# Altium schematic sheet Battery_Charging_Section.SchDoc
size A4; DocumentNumber: 3; SheetNumber: 3; SheetTotal: 8
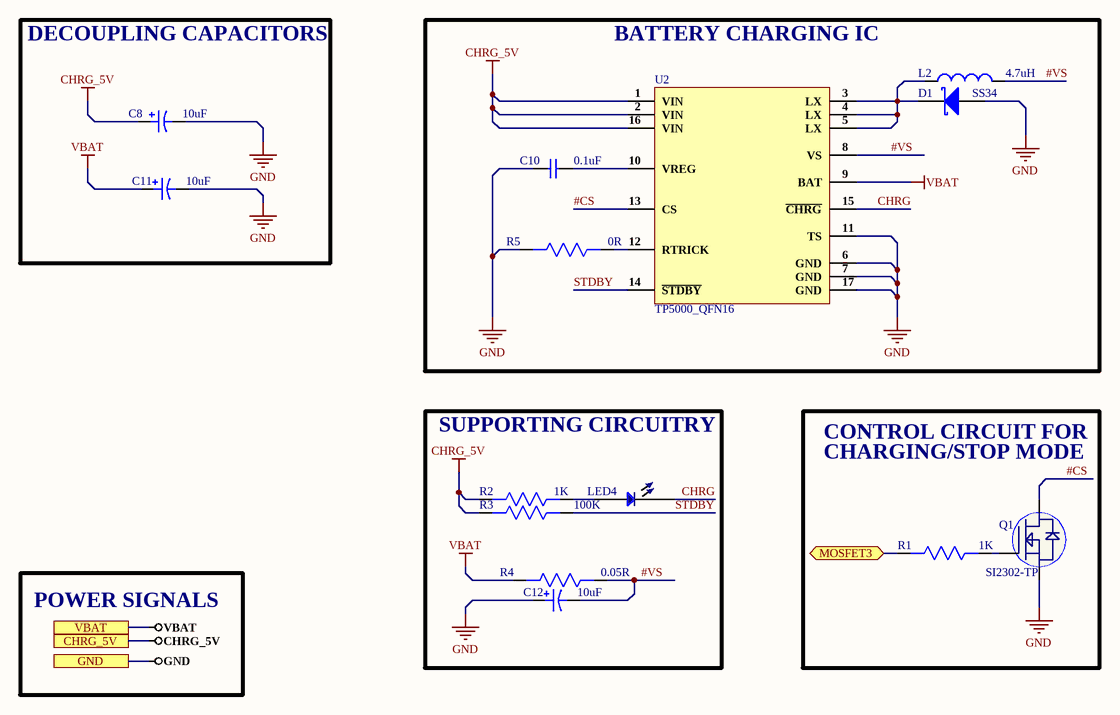
[diagram p0: Battery_Charging_Section.SchDoc]

## Parts
C8  10uF  [UWX1H100MCL1GB]
C10  0.1uF  [Cap0603]
C11  10uF  [UWX1H100MCL1GB]
C12  10uF  [UWX1H100MCL1GB]
D1  SS34  [SMA]
L2  4.7uH  [NR5040T4R7N]
LED4  204-10SURT/S530-A3  [TH-LED]  (value not drawn)
Q1  SI2302-TP  [SI2302-TP]
R1  1K  [Res0603]
R2  1K  [Res0603]
R3  100K  [Res0603]
R4  0.05R  [Res0603]
R5  0R  [Res0603]
U2  TP5000_QFN16  [16-QFN (4x4)]

## Blocks framed on the sheet
DECOUPLING CAPACITORS: C8 C11
BATTERY CHARGING IC: C10 D1 L2 R5 U2
SUPPORTING CIRCUITRY: C12 LED4 R2-R4

## Ports
CHRG_5V, GND, MOSFET3 (bidir), VBAT

## Nets
CHRG_5V: C8.1 R2.2 R3.2 U2.1(VIN) U2.2(VIN) U2.16(VIN) ; port CHRG_5V
GND: C8.2 C10.1 C11.2 C12.1 D1.1(A) Q1.2(S) R5.2 U2.6(GND) U2.7(GND) U2.11(TS) U2.17(GND) ; port GND
VBAT: C11.1 R4.2 U2.9(BAT) ; port VBAT
#CS: Q1.3(D) U2.13(CS)
#VS: C12.2 L2.2 R4.1 U2.8(VS)
CHRG: LED4.1 U2.15(~{CHRG})
MOSFET3: R1.2 ; port MOSFET3
STDBY: R3.1 U2.14(~{STDBY})
NetC10_2: C10.2 U2.10(VREG)
NetD1_2: D1.2(K) L2.1 U2.3(LX) U2.4(LX) U2.5(LX)
NetLED4_2: LED4.2 R2.1
NetQ1_1: Q1.1(G) R1.1
NetR5_1: R5.1 U2.12(RTRICK)

## Notes on the sheet
- CONTROL CIRCUIT FOR
- (near Q1) CHARGING/STOP MODE
- POWER SIGNALS

## Library data of the parts
C8 C11 C12 = UWX1H100MCL1GB: CAP ALUM 10UF 20% 50V SMD; Manufacturer: Nichicon; ComponentLink1Description: New link; ComponentLink1URL: https://www.digikey.co.uk/en/products/detail/nichicon/UWX1H100MCL1GB/589876?s=N4IgTCBcDaIKoHUAaBGAEigDJgsgYQBkUBxAIRAF0BfIA; Manufacturer Part no:: UWX1H100MCL1GB; Value: 10uF; Package: 0.260" L x 0.260" W (6.60mm x 6.60mm)
C10 = CC0603ZRY5V9BB104: CAP CER 0.1UF 50V Y5V 0603; Manufacturer: Yageo; Capacitance: 100nF; Tolerance: 80%; Supplier 1: Digi-Key; Manufacturer Part Number: CC0603ZRY5V9BB104; Stock 1: 15000880; Pricing 1: 1=0.1, 10=0.075, 100=0.0334, 500=0.02386, 1000=0.01874 (USD); Mount: Surface Mount; Case/Package: 0603; Number of Pins: 2; Case Code (Metric): 1608; Case Code (Imperial): 0603; Min Operating Temperature: -30°C; Max Operating Temperature: 85°C; Dielectric: Y5V; Voltage Rating: 50V; Package Quantity: 1; Packaging: Tape and Reel; Voltage Rating (DC): 50V; Termination: SMD/SMT; Composition: Ceramic; Voltage: 50V; Length: 1.6mm; Height: 0.8mm; Width: 0.031inch; Thickness: 0.035inch; Depth: 0.8mm; Radiation Hardening: No; REACH SVHC: No SVHC; Lead Free: Lead Free; Halogen Free: Halogen Free; ComponentLink1URL: http://www.yageo.com/documents/recent/UPY-GPHC_Y5V_6.3V-to-50V_8.pdf?src-supplier=Digi-Key; ComponentLink1Description: http://www.yageo.com/documents/recent/UPY-GPHC_Y5V_6.3V-to-50V_8.pdf?src-supplier=Digi-Key; ComponentLink2URL: http://www.yageo.com/documents/recent/UPY-GPHC_Y5V_6.3V-to-50V_5.pdf?src-supplier=Avnet+Europe; ComponentLink2Description: http://www.yageo.com/documents/recent/UPY-GPHC_Y5V_6.3V-to-50V_5.pdf?src-supplier=Avnet+Europe; ComponentLink3URL: https://www.verical.com/server-webapp/html/getDatasheet?partID=403611&src-supplier=Verical; ComponentLink3Description: https://www.verical.com/server-webapp/html/getDatasheet?partID=403611&src-supplier=Verical; ComponentLink4URL: http://www.mouser.com/ds/2/447/Yageo_UPY-GP_NP0_16V-to-50V_9-358835.pdf?src-supplier=Mouser; ComponentLink4Description: http://www.mouser.com/ds/2/447/Yageo_UPY-GP_NP0_16V-to-50V_9-358835.pdf?src-supplier=Mouser; ComponentLink5URL: http://www.farnell.com/datasheets/1132289.pdf?src-supplier=Element14; ComponentLink5Description: http://www.farnell.com/datasheets/1132289.pdf?src-supplier=Element14; Supplier Part Number 1: 311-1343-1-ND
D1 = SS34: 40V 550mV 3A 3A SMA(DO-214AC) Schottky Barrier Diodes (SBD); Manufacturer: Changzhou; Value: Custom; Manufacturer Part No: SS34; Package: SMA(DO-214AC); ComponentLink1Description: LCSC; ComponentLink1URL: https://lcsc.com/product-detail/Schottky-Barrier-Diodes-SBD_Changzhou-Starsea-Elec-SS34_C83961.html
L2 = NR5040T4R7N: Inductor Power Shielded Wirewound 4.7uH 30% 100KHz Ferrite 3.1A 0.0377Ohm DCR T/R; Manufacturer: Taiyo Yuden; Self Resonant Frequency: 28MHz; Saturation Current: 3.3A; DC Resistance (DCR): 37.7mR; Supplier 1: Digi-Key; Manufacturer Part Number: NR5040T4R7N; RoHS: Yes; Category: Fixed Inductors; Stock 1: 62864; Pricing 1: 1=0.48000, 10=0.42700, 25=0.37360, 50=0.32000, 100=0.29340, 250=0.26676, 500=0.25074 (USD); Mount: Surface Mount; Case/Package: Nonstandard; Number of Pins: 2; Core Material: Ferrite; Min Operating Temperature: -25°C; Max Operating Temperature: 120°C; Packaging: Tape and Reel; Inductance Tolerance: 30%; Package Quantity: 1500; Current Rating: 3.1A; Tolerance: 30%; Shielding: Shielded; Inductance: 4.7uH; Max DC Current: 3.3A; Termination: SMD/SMT; Resistor Type: Wirewound; Test Frequency: 100kHz; RMS Current (Irms): 3.1A; Series: NR; Length: 0.193inch; Width: 4.9mm; Height: 4mm; Height - Seated (Max): 0.161inch; Depth: 5.1mm; Radiation Hardening: No; REACH SVHC: Unknown; Halogen Free: Halogen Free; RoHS Compliant: Yes; ComponentLink1URL: https://datasheet.ciiva.com/8502/nr5040t4r7n-ss-8502907.pdf?src-supplier=Avnet; ComponentLink1Description: https://datasheet.ciiva.com/8502/nr5040t4r7n-ss-8502907.pdf?src-supplier=Avnet; ComponentLink2URL: https://datasheet.ciiva.com/1044/wound04-e-1044092.pdf?src-supplier=Digi-Key; ComponentLink2Description: https://datasheet.ciiva.com/1044/wound04-e-1044092.pdf?src-supplier=Digi-Key; ComponentLink3URL: https://datasheet.ciiva.com/1044/wound04-e-1044093.pdf?src-supplier=Digi-Key; ComponentLink3Description: https://datasheet.ciiva.com/1044/wound04-e-1044093.pdf?src-supplier=Digi-Key; ComponentLink4URL: https://datasheet.ciiva.com/4960/wound04-e-4960327.pdf?src-supplier=Mouser; ComponentLink4Description: https://datasheet.ciiva.com/4960/wound04-e-4960327.pdf?src-supplier=Mouser; ComponentLink5URL: https://datasheet.ciiva.com/1044/wound04-e-1044091.pdf?src-supplier=Digi-Key; ComponentLink5Description: https://datasheet.ciiva.com/1044/wound04-e-1044091.pdf?src-supplier=Digi-Key; Supplier Part Number 1: 587-2373-1-ND
LED4 = 204-10SURT/S530-A3: Red 624nm Through Hole Light Emitting Diodes (LED) ROHS; Manufacturer: Everlight Elec; Manufacturer Part no:: 204-10SURT/S530-A3; Footprint: Custom
Q1 = SI2302-TP: SI2302 Series 20 3 A N-Ch Enhancement Mode Field Effect Transistor - SOT-23-3; Manufacturer: MCC; Rds On Max: 72mR; Input Capacitance: 237pF; Drain to Source Voltage (Vdss): 20V; Continuous Drain Current (ID): 3A; Max Power Dissipation: 1.25W; Drain to Source Resistance: 110mR; Number of Elements: 1; Gate to Source Voltage (Vgs): 8V; Polarity: N-CHANNEL; Supplier 1: Digi-Key; Manufacturer Part Number: SI2302-TP; RoHS: Yes; Category: Transistors; Stock 1: 13753; Pricing 1: 1=0.50000, 10=0.40300, 100=0.27460, 500=0.20592, 1000=0.15444 (USD); Mount: Surface Mount; Case/Package: SOT-23; Number of Pins: 3; Min Operating Temperature: -55°C; Max Operating Temperature: 150°C; Packaging: Tape and Reel; Package Quantity: 3000; Drain to Source Breakdown Voltage: 20V; Power Dissipation: 1.25W; Lead Free: Lead Free; RoHS Compliant: Yes; ComponentLink1URL: https://datasheet.ciiva.com/935/si2302sot-23-935107.pdf?src-supplier=Digi-Key; ComponentLink1Description: https://datasheet.ciiva.com/935/si2302sot-23-935107.pdf?src-supplier=Digi-Key; ComponentLink2URL: https://datasheet.ciiva.com/935/si2302sot-23-935109.pdf?src-supplier=Digi-Key; ComponentLink2Description: https://datasheet.ciiva.com/935/si2302sot-23-935109.pdf?src-supplier=Digi-Key; ComponentLink3URL: https://datasheet.ciiva.com/935/si2302sot-23-935108.pdf?src-supplier=Digi-Key; ComponentLink3Description: https://datasheet.ciiva.com/935/si2302sot-23-935108.pdf?src-supplier=Digi-Key; Supplier Part Number 1: SI2302-TPMSCT-ND
R1 R2 = RC0603FR-071KL: RES SMD 1K OHM 1% 1/10W 0603; Manufacturer: Yageo; Resistance: 1kR; Temperature Coefficient: 100ppm/°C; Power Rating: 100mW; Voltage Rating: 50V; ComponentLink1URL: https://www.verical.com/server-webapp/html/getDatasheet?partID=409289&src-supplier=Verical; ComponentLink1Description: https://www.verical.com/server-webapp/html/getDatasheet?partID=409289&src-supplier=Verical; Supplier 1: Digi-Key; Manufacturer Part Number: RC0603FR-071KL; Stock 1: 21472395; Pricing 1: 1=0.1, 10=0.023, 100=0.0094, 1000=0.0042, 2500=0.0037 (USD); Case/Package: 0603; Contact Plating: Tin,Matte; Case Code (Imperial): 0603; Case Code (Metric): 1608; Min Operating Temperature: -55°C; Max Operating Temperature: 155°C; Tolerance: 1%; Composition: Thick Film; Packaging: Tape and Reel; Termination: SMD/SMT; Military Standard: Not; Length: 1.6mm; Height: 0.45mm; Depth: 0.8mm; Radiation Hardening: No; REACH SVHC: No SVHC; Lead Free: Lead Free; ComponentLink2URL: http://documents.rs-components.com/techlib://itc_doclist_GB.htm?stockno=5048928&src-supplier=RSComponents; ComponentLink2Description: http://documents.rs-components.com/techlib://itc_doclist_GB.htm?stockno=5048928&src-supplier=RSComponents; ComponentLink3URL: http://www.yageo.com/documents/recent/PYu-RC0603_51_RoHS_L_4.pdf?src-supplier=Avnet+Europe; ComponentLink3Description: http://www.yageo.com/documents/recent/PYu-RC0603_51_RoHS_L_4.pdf?src-supplier=Avnet+Europe; ComponentLink4URL: http://www.farnell.com/datasheets/2167052.pdf?src-supplier=Element14; ComponentLink4Description: http://www.farnell.com/datasheets/2167052.pdf?src-supplier=Element14; ComponentLink5URL: http://www.farnell.com/datasheets/1868787.pdf?src-supplier=Element14; ComponentLink5Description: http://www.farnell.com/datasheets/1868787.pdf?src-supplier=Element14; ComponentLink6URL: http://www.yageo.com/documents/recent/PYu-RC_Group_51_RoHS_L_2.pdf?src-supplier=Avnet; ComponentLink6Description: http://www.yageo.com/documents/recent/PYu-RC_Group_51_RoHS_L_2.pdf?src-supplier=Avnet; ComponentLink7URL: https://www.verical.com/server-webapp/html/getDatasheet?partID=404327&src-supplier=Verical; ComponentLink7Description: https://www.verical.com/server-webapp/html/getDatasheet?partID=404327&src-supplier=Verical; ComponentLink8URL: http://www.farnell.com/datasheets/443971.pdf?src-supplier=Element14; ComponentLink8Description: http://www.farnell.com/datasheets/443971.pdf?src-supplier=Element14; Supplier Part Number 1: 311-1.00KHRDKR-ND
R3 = RC0603FR-07100KL: RES SMD 100K OHM 1% 1/10W 0603
R4 = WSL0603R0500FEA: RES 0.05 OHM 1% 1/10W 0603; Manufacturer: Vishay Dale; Manufacturer Part Number: WSL0603R0500FEA18; Resistance: 50mR; Temperature Coefficient: 75ppm/°C; Power Rating: 200mW; Supplier 1: Mouser; Stock 1: 4596; Pricing 1: 1=0.96, 10=0.717, 50=0.717, 100=0.621, 1000=0.375, 10000=0.326 (USD); Case/Package: 0603; Case Code (Metric): 1608; Case Code (Imperial): 0603; Min Operating Temperature: -65°C; Max Operating Temperature: 170°C; Tolerance: 1%; Resistor Type: Metal Strip; Packaging: Tape and Reel; Package Quantity: 1; Number of Terminations: 2; Termination: SMD/SMT; Max Power Dissipation: 200mW; Features: Moisture Resistant; Series: WSL-HP; Resistance Tolerance: 1%; Length: 0.06inch; Width: 0.03inch; Height: 0.018inch; REACH SVHC: Unknown; Lead Free: Lead Free; RoHS Compliant: Yes; ComponentLink1URL: http://www.vishay.com/docs/31057/wslhigh.pdf?src-supplier=Digi-Key; ComponentLink1Description: http://www.vishay.com/docs/31057/wslhigh.pdf?src-supplier=Digi-Key; ComponentLink2URL: http://www.mouser.com/ds/2/427/wslhigh-101698.pdf?src-supplier=Mouser; ComponentLink2Description: http://www.mouser.com/ds/2/427/wslhigh-101698.pdf?src-supplier=Mouser; Supplier Part Number 1: 71-WSL0603R0500FEA18
R5 = RC0603FR-070RL: RES SMD 0R, 1%, 0.1W, 0603; Manufacturer: Yageo; Resistance: 0mR; Power Rating: 100mW; Voltage Rating (DC): 50V; Temperature Coefficient: 200ppm/°C; Current Rating: 1A; Working Voltage: 75V; Supplier 1: Arrow Electronics; Manufacturer Part Number: RC0603FR-070RL; RoHS: Yes; Category: Chip SMD Resistors; Stock 1: 1270000; Pricing 1: 5000=0.00320, 5000=0.00490, 50000=0.00450, 500000=0.00250, 2500000=0.00150 (USD); Case/Package: 0603; Number of Pins: 2; Contact Plating: Tin,Matte; Case Code (Metric): 1608; Case Code (Imperial): 0603; Min Operating Temperature: -55°C; Max Operating Temperature: 155°C; Resistor Type: Thick Film; Packaging: Tape and Reel; Tolerance: 1%; Package Quantity: 5000; Voltage Rating: 50V; Number of Terminations: 2; Termination: SMD/SMT; Max Power Dissipation: 100mW; Features: Moisture Resistant; Length: 1.6mm; Width: 0.031inch; Height: 0.45mm; Depth: 0.8mm; Radiation Hardening: No; REACH SVHC: No SVHC; Lead Free: Lead Free; Military Standard: Not; ComponentLink1URL: https://datasheet.ciiva.com/11808/0900766b80f96399-11808172.pdf?src-supplier=RSComponents; ComponentLink1Description: https://datasheet.ciiva.com/11808/0900766b80f96399-11808172.pdf?src-supplier=RSComponents; ComponentLink2URL: https://datasheet.ciiva.com/5558/rc0603-272842-5558341.pdf?src-supplier=Mouser; ComponentLink2Description: https://datasheet.ciiva.com/5558/rc0603-272842-5558341.pdf?src-supplier=Mouser; ComponentLink3URL: https://datasheet.ciiva.com/46382/443971-46382072.pdf?src-supplier=Element14; ComponentLink3Description: https://datasheet.ciiva.com/46382/443971-46382072.pdf?src-supplier=Element14; ComponentLink4URL: https://datasheet.ciiva.com/29721/pyu-r-int-thick-7-29721178.pdf?src-supplier=Digi-Key; ComponentLink4Description: https://datasheet.ciiva.com/29721/pyu-r-int-thick-7-29721178.pdf?src-supplier=Digi-Key; ComponentLink5URL: https://datasheet.ciiva.com/5684/443971-5684699.pdf?src-supplier=Farnell; ComponentLink5Description: https://datasheet.ciiva.com/5684/443971-5684699.pdf?src-supplier=Farnell; ComponentLink6URL: https://datasheet.ciiva.com/7983/443971-7983627.pdf?src-supplier=Element14; ComponentLink6Description: https://datasheet.ciiva.com/7983/443971-7983627.pdf?src-supplier=Element14; ComponentLink7URL: https://datasheet.ciiva.com/29721/pyu-rc0603-51-rohs-l-4-29721179.pdf?src-supplier=Digi-Key; ComponentLink7Description: https://datasheet.ciiva.com/29721/pyu-rc0603-51-rohs-l-4-29721179.pdf?src-supplier=Digi-Key; ComponentLink8URL: https://datasheet.ciiva.com/22643/1868787-22643388.pdf?src-supplier=Element14; ComponentLink8Description: https://datasheet.ciiva.com/22643/1868787-22643388.pdf?src-supplier=Element14; Supplier Part Number 1: RC0603FR-070RL
U2 = TP5000_QFN16: QFN-16_4x4x065P Battery Management ICs ROHS; Manufacturer: TOPPOWER; Manufacturer Part No: TP5000_QFN16; Package: 16 QFN 4x4; ComponentLink1Description: LCSC; ComponentLink1URL: https://lcsc.com/product-detail/Battery-Management-ICs_TOPPOWER-Nanjing-Extension-Microelectronics-TP5000-QFN16_C51699.html